# Altium project Projekt_Power.PrjPcb
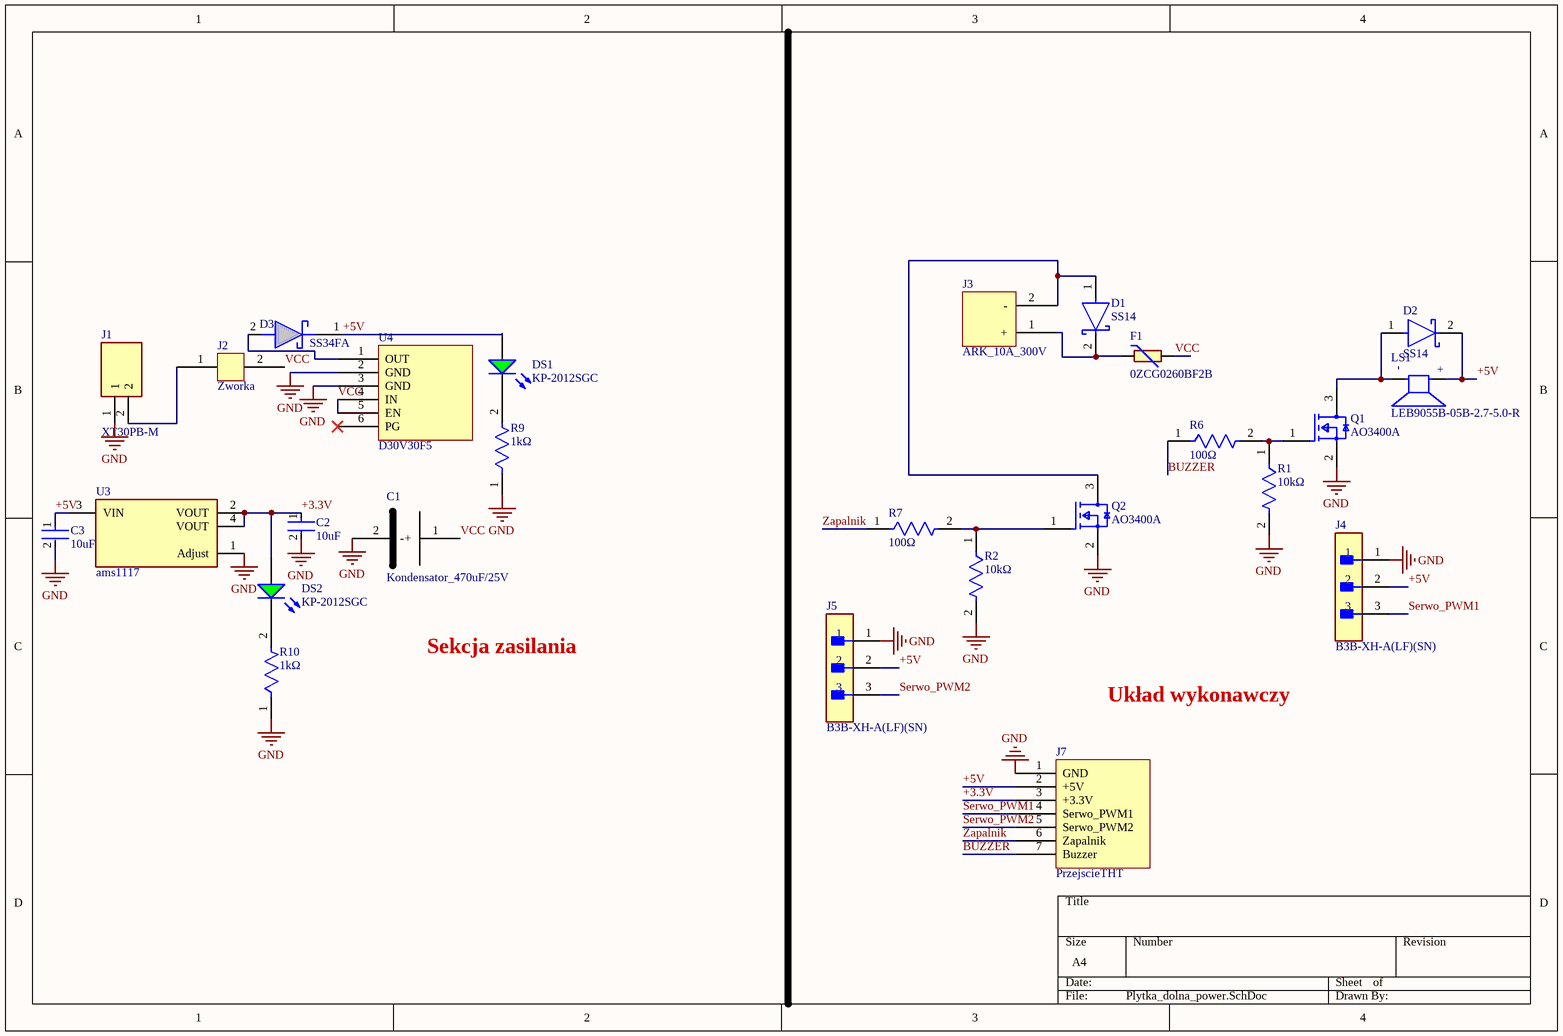
[diagram p0: Plytka_dolna_power.SchDoc]
1 sheet, 26 parts. Net scope: global (net labels, ports and power ports of the same name join across sheets).
Board file: Plytka_power.PcbDoc

## Sheet Plytka_dolna_power.SchDoc
size A4; SheetNumber: 1; SheetTotal: 1

### Parts
C1  Kondensator_470uF/25V  [Capacitor_470uF/25V]
C2  10uF  [FP-C0805C-DN-MFG]
C3  10uF  [FP-C0805C-DN-MFG]
D1  SS14  [FP-403AE-MFG]
D2  SS14  [FP-403AE-MFG]
D3  SS34FA  [SODFL3618X143N]
DS1  KP-2012SGC  [KING-KP-2012SGC_V]
DS2  KP-2012SGC  [KING-KP-2012SGC_V]
F1  0ZCG0260BF2B  [FUSER_0ZCG0260BF2B]
J1  XT30PB-M  [XT30PBM]
J2  Zworka  [Zworka]
J3  ARK_10A_300V  [ARK_10A_300V]
J4  B3B-XH-A(LF)(SN)  [FP-B3B-XH-A_LF_SN-MFG]
J5  B3B-XH-A(LF)(SN)  [FP-B3B-XH-A_LF_SN-MFG]
J7  PrzejscieTHT  [PrzejscieTHT]
LS1  LEB9055B-05B-2.7-5.0-R  [XDCR_AI-1027-TWT-3V-R]
Q1  AO3400A  [FP-SOT23-MFG]
Q2  AO3400A  [FP-SOT23-MFG]
R1  10kΩ  [FP-CRGCQ0805-IPC_C]
R2  10kΩ  [FP-CRGCQ0805-IPC_C]
R6  100Ω  [FP-CRGCQ0805-IPC_C]
R7  100Ω  [FP-CRGCQ0805-IPC_C]
R9  1kΩ  [FP-CRGCQ0805-IPC_C]
R10  1kΩ  [FP-CRGCQ0805-IPC_C]
U3  ams1117  [FP-ams1117-IPC_C]
U4  D30V30F5  [D30V30F5]

### Nets
GND: C1.2(-) C2.2 C3.2 J1.1 J4.1 J5.1 J7.1(GND) Q1.2(S) Q2.2(S) R1.2 R2.2 R9.1 R10.1 U3.1(Adjust) U4.2(GND) U4.3(GND)
+3.3V: C2.1 DS2.1(A) J7.3(+3.3V) U3.2(VOUT) U3.4(VOUT)
+5V: C3.1 D2.2(C) D3.1(K) DS1.1(A) J4.2 J5.2 J7.2(+5V) LS1.P U3.3(VIN)
BUZZER: J7.7(Buzzer) R6.1
Serwo_PWM1: J4.3 J7.4(Serwo_PWM1)
Serwo_PWM2: J5.3 J7.5(Serwo_PWM2)
VCC: C1.1(+) F1.2 J2.2 U4.4(IN) U4.5(EN)
Zapalnik: J7.6(Zapalnik) R7.1
NetD1_1: D1.1(A) J3.2(-) Q2.3(D)
NetD1_2: D1.2(C) F1.1 J3.1(+)
NetD2_1: D2.1(A) LS1.N Q1.3(D)
NetD3_2: D3.2(A) U4.1(OUT)
NetDS1_2: DS1.2(K) R9.2
NetDS2_2: DS2.2(K) R10.2
NetJ1_2: J1.2 J2.1
NetQ1_1: Q1.1(G) R1.1 R6.2
NetQ2_1: Q2.1(G) R2.1 R7.2

Not connected (* = marked no-connect by the designer): U4 6(PG)*

### Notes on the sheet
- Sekcja zasilania
- Układ wykonawczy
- (in symbol AI-1027-TWT-3V-R) -; +

### Library data of the parts
C2 C3 = CMP-2007-00274-2: CAP CER 10UF 16V X7R 0805; Manufacturer Part Number: C0805C104K4RACTU; Manufacturer: KEMET; Material: Ceramic; Tolerance: 0.1; Capacitance: 10μF; Value: 10μF; Temperature Coefficient: 30ppm/°C; Device Class L3: Ceramic Capacitors; RoHS: TRUE; Octopart: https://octopart.com/c0805c104k4ractu-kemet-92155; ComponentLink2Description: Datasheet; ComponentLink2URL: https://content.kemet.com/datasheets/KEM_C1003_C0G_SMD.pdf; Temperature Range High: +125°C; Category: Cap; Lead Free: Yes; Digikey Description: CAP CER 0.1UF 16V X7R 0805; Automotive: No; Temperature Range Low: -55°C; Voltage Rating: 16 V; Package: C0805C-DN; Ipc Land Pattern Name: CAPC200125X78; Height: 0.88mm; Device Class L1: Passive Components; Temperature: -55°C to +125°C; Mouser Description: Multilayer Ceramic Capacitors MLCC - SMD/SMT 16volts 0.1uF X7R 10%; Device Class L2: Capacitors; Temperature Characteristic: X7R
D1 D2 = CMP-2000-04943-2: DIODE SCHOTTKY 40V 1A SMA; Manufacturer: ON Semiconductor; Peak Reverse Current: 0.2mA; Max Junction Temp: +125°C; Standoff Height: 0.05mm; Max Surge Forward Current: 40A; Mouser Description: Schottky Diodes & Rectifiers SMA 40V 1.0A; RoHS: TRUE; Lead Free: Yes; Manufacturer Part Number: SS14; Device Class L3: Schottky Diodes; Category: Diode; Automotive: No; Digikey Description: DIODE SCHOTTKY 40V 1A SMA; ComponentLink2Description: Datasheet; Device Class L2: Diodes; Height: 2.5mm; Temperature Range High: +125°C; ComponentLink2URL: https://www.onsemi.com/pub/Collateral/SS19-D.PDF; Device Class L1: Discrete Semiconductors; Package: 403AE; Octopart: https://octopart.com/ss14-on+semiconductor-29205033; Max Repetitive Reverse Voltage: 40V; Temperature Range Low: -65°C; Forward Current: 1A; Temperature: -65°C to +125°C
D3 = SS34FA: UL Flammability 94V-0 Classification; MSL 1 per J-STD-020; Low Power Loss, High Efficiency; Guard Ring for Overvoltage Protection; RoHS Compliant / Green Molding Compound; High Surge Current Capability; NRVB Prefix for Automotive and Other Applications Requiring Unique Site and Control Change Requirements; AECQ101 Qualified and PPAP Capable; Manufacturer_Name: onsemi; Geometry.Height: 1.43mm; Manufacturer_Part_Number: SS34FA; Mouser Part Number: 512-SS34FA; Mouser Price/Stock: https://www.mouser.co.uk/ProductDetail/onsemi-Fairchild/SS34FA?qs=R26iFe%2FkX%2FK1QUwZdCmBBw%3D%3D; Arrow Part Number: SS34FA; Arrow Price/Stock: https://www.arrow.com/en/products/ss34fa/on-semiconductor.html?utm_currency=USD&region=nac; Datasheet Link: https://www.onsemi.com/pub/Collateral/SS36FA-D.PDF
DS1 DS2 = CMP-2000-06517-1: LED Green, 62.5 mW, 25 mA, -40 to 85 degC, 4-Pin SMD, RoHS, Tape and Reel; Manufacturer: Kingbright; Forward Voltage: 2.2V; Luminous Intensity Typ: 20mcd; No. of Pins: 2; Wavelength Typ: 568nm; LED / Lamp Size: 1.3mmx1.25mm; Voltage Vf Typ: 2.1V; External Width: 2.0mm; LED Type: Standard; Material: GaP; SVHC: NoSVHC(16-Dec-2013); External Depth: 1.25mm; Forward Current If: 20mA; External Length / Height: 1.1mm; PIV Max: 5V; Peak Forward Current: 30mA; Luminous Intensity: 12mcd; Forward Voltage VF Max: 2.5V; Viewing Angle: 120°; Lens Shape: Rectangular; Bulb Size: 1.25mmx1.3mm; Peak Wavelength: 565nm; Luminous Intensity @ If Min: 4mcd; Mounting Technology: SurfaceMount; Mounting Type: SMD; Packaging: CutTape; MSL: MSL3-168hours; Package Reference: KP-2012SGC; Operating Temperature Max: 85°C; Current If Luminous Intensity: 20mA; Forward Current If Max: 20mA; Manufacturer URL: http://www.kingbright.com/; Datasheet URL: https://datasheet.ciiva.com/14176/kp2012sgc-eng-tds-14176961.pdf; Operating Temperature Min: -40°C; Dominant Wavelength: 568nm; Package Description: 2-Pin Surface Mount Device, Body 2 x 1.25 mm; Operating Temperature Range: -40°Cto+85°C; LED Colour: Green; Datasheet Version: Rev. 15, 09/2010; LED Mounting: SMD
F1 = 0ZCG0260BF2B: MF: {'manufacturer': u'Bel Fuse'}; Package: None; Price: None; Value: *; MP: 0ZCG0260BF2B; Availability: Unavailable
J1 = XT30PB-M: Brass Gold Plated Connector 0.65m , 500VDC , 15A , -20 to 120; Manufacturer_Name: Amass; Geometry.Height: 10.7mm; Manufacturer_Part_Number: XT30PB-M; Mouser Part Number: *; Mouser Price/Stock: *; Arrow Part Number: *; Arrow Price/Stock: *; Datasheet Link: https://g.componentsearchengine.com/ga/Vtm2s6UR3EprZ4UN
J4 J5 = CMP-17439-000014-3: CONN HEADER VERT 3POS 2.5MM; Max Voltage Rating (DC): 250V; Number of Positions: 3; Current Rating: 3A; Gender: Male; Wire/Cable Gauge: 22AWG; Contact Resistance: 20mR; Insulation Resistance: 1GR; Insulation Material: Nylon; Contact Plating: Tin; Depth: 5.75mm; Contact Type: Male Pin; Max Operating Temperature: 85°C; Insulation Color: Natural; Voltage Rating (AC): 250V; Color: Natural; Connector Type: Header; Orientation: Straight; Fastening Type: Detent; Housing Color: White; Min Operating Temperature: -25°C; Termination: Solder; Voltage Rating: 250V; Series: XH; Pitch: 2.5mm; Contact Shape: Square; Number of Rows: 1; Lead Free: Lead Free; Packaging: Bulk; Mount: Through Hole; Flammability Rating: UL94 V-0; Max Voltage Rating (AC): 250V; REACH SVHC: No SVHC; Housing Material: Polyamide; Contact Material: Brass; Lead Pitch: 2.5mm; Contact Finish - Mating: TIN; Length: 9.9mm; Max Current Rating: 3A; Number of Contacts: 3
LS1 = AI-1027-TWT-3V-R: AUDIO INDICATOR 3VDC 30MA 80DBA 2700HZ; MF: PUI Audio; SnapEDA_Link: https://www.snapeda.com/parts/AI-1027-TWT-3V-R/PUI+Audio%252C+Inc./view-part/?ref=snap; Package: None; Value: *; MP: AI-1027-TWT-3V-R; Check_prices: https://www.snapeda.com/parts/AI-1027-TWT-3V-R/PUI+Audio%252C+Inc./view-part/?ref=eda
Q1 Q2 = CMP-83955-000006-1: MOSFET N-CH 30V 5.7A SOT23; Input Capacitance: 630pF; Number of Elements: 1; Rds On Max: 26.5mR; Max Power Dissipation: 1.4W; Gate to Source Voltage (Vgs): 12V; Min Operating Temperature: -55°C; Lead Free: Lead Free; Number of Pins: 3; Drain to Source Voltage (Vdss): 30V; Case/Package: SOT-23; Mount: Surface Mount; Continuous Drain Current (ID): 5.7A; Radiation Hardening: No; Packaging: Tape and Reel; Max Operating Temperature: 150°C; Power Dissipation: 1.4W
R1 R2 = CMP-03211-002989-1: CRGCQ 0805 10K 5%; Manufacturer Part Number: CRGCQ0805J10K; Manufacturer: TE Connectivity; Voltage Rating: 150V; Temperature Coefficient: ±100ppm/°C; Power Rating: 0.125W; Tolerance: 0.05; Automotive Grade: Grade 914; Height: 0.65mm; Lead Free: Yes; Temperature Range High: +155°C; Composition: Thick Film; Temperature Range Low: -55°C; Resistance: 10KΩ; Ambient Temperature Range High: +70°C; Temperature: -55°C to +155°C; Package: CRGCQ0805; Device Class L2: Resistors; RoHS: TRUE; ComponentLink2URL: https://www.te.com/commerce/DocumentDelivery/DDEController?Action=showdoc&DocId=Data+Sheet%7F1773204-3%7F1%7Fpdf%7FEnglish%7FENG_DS_1773204-3_1.pdf%7F4-2176341-923; Series: CRGCQ; Device Class L1: Passive Components; Ipc Land Pattern Name: RESC200125X55; Value: 10KΩ; ComponentLink2Description: Datasheet; Category: Res; Digikey Description: CRGCQ 0805 10K 5%; Mouser Description: Res Thick Film 0805 10K Ohm 5% 0.125W(1/8W) ±100ppm/C Pad SMD Automotive T/R; Automotive: Yes; Octopart: https://octopart.com/crgcq0805j10k-te+connectivity-91018201; Device Class L3: Chip SMD Resistors
R6 R7 = CMP-03211-002989-1: CRGCQ 0805 100 5%; Manufacturer Part Number: CRGCQ0805J10K; Manufacturer: TE Connectivity; Voltage Rating: 150V; Temperature Coefficient: ±100ppm/°C; Power Rating: 0.125W; Tolerance: 0.05; Automotive Grade: Grade 914; Height: 0.65mm; Lead Free: Yes; Temperature Range High: +155°C; Composition: Thick Film; Temperature Range Low: -55°C; Resistance: 100Ω; Ambient Temperature Range High: +70°C; Temperature: -55°C to +155°C; Package: CRGCQ0805; Device Class L2: Resistors; RoHS: TRUE; ComponentLink2URL: https://www.te.com/commerce/DocumentDelivery/DDEController?Action=showdoc&DocId=Data+Sheet%7F1773204-3%7F1%7Fpdf%7FEnglish%7FENG_DS_1773204-3_1.pdf%7F4-2176341-923; Series: CRGCQ; Device Class L1: Passive Components; Ipc Land Pattern Name: RESC200125X55; Value: 100Ω; ComponentLink2Description: Datasheet; Category: Res; Digikey Description: CRGCQ 0805 10K 5%; Mouser Description: Res Thick Film 0805 10K Ohm 5% 0.125W(1/8W) ±100ppm/C Pad SMD Automotive T/R; Automotive: Yes; Octopart: https://octopart.com/crgcq0805j10k-te+connectivity-91018201; Device Class L3: Chip SMD Resistors
R9 R10 = CMP-03211-002989-1: CRGCQ 0805 1K 5%; Manufacturer Part Number: CRGCQ0805J10K; Manufacturer: TE Connectivity; Voltage Rating: 150V; Temperature Coefficient: ±100ppm/°C; Resistance: 10KΩ; Value: 10KΩ; Power Rating: 0.125W; Tolerance: 0.05; Automotive Grade: Grade 914; Height: 0.65mm; Lead Free: Yes; Temperature Range High: +155°C; Composition: Thick Film; Temperature Range Low: -55°C; Ambient Temperature Range High: +70°C; Temperature: -55°C to +155°C; Package: CRGCQ0805; Device Class L2: Resistors; RoHS: TRUE; ComponentLink2URL: https://www.te.com/commerce/DocumentDelivery/DDEController?Action=showdoc&DocId=Data+Sheet%7F1773204-3%7F1%7Fpdf%7FEnglish%7FENG_DS_1773204-3_1.pdf%7F4-2176341-923; Series: CRGCQ; Device Class L1: Passive Components; Ipc Land Pattern Name: RESC200125X55; ComponentLink2Description: Datasheet; Category: Res; Digikey Description: CRGCQ 0805 10K 5%; Mouser Description: Res Thick Film 0805 10K Ohm 5% 0.125W(1/8W) ±100ppm/C Pad SMD Automotive T/R; Automotive: Yes; Octopart: https://octopart.com/crgcq0805j10k-te+connectivity-91018201; Device Class L3: Chip SMD Resistors
U3 = CMP-209535-000002-1: 1A LOW DROPOUT VOLTAGE REGULATOR; RoHS Compliant: Yes